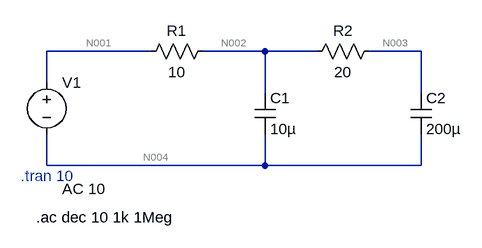
[diagram p0: schematic RC circuit control.asc]
RC circuit control.asc, the LTspice schematic file:
Version 4.1
SHEET 1 880 680
WIRE 224 80 64 80
WIRE 400 80 304 80
WIRE 480 80 400 80
WIRE 640 80 560 80
WIRE 64 128 64 80
WIRE 400 144 400 80
WIRE 640 144 640 80
WIRE 64 256 64 208
WIRE 400 256 400 208
WIRE 400 256 64 256
WIRE 640 256 640 208
WIRE 640 256 400 256
SYMBOL voltage 64 112 R0
WINDOW 3 24 152 Left 2
WINDOW 123 24 180 Left 2
WINDOW 39 0 0 Left 0
SYMATTR Value ""
SYMATTR Value2 AC 10
SYMATTR InstName V1
SYMBOL res 320 64 R90
WINDOW 0 0 56 VBottom 2
WINDOW 3 32 56 VTop 2
SYMATTR InstName R1
SYMATTR Value 10
SYMBOL res 576 64 R90
WINDOW 0 0 56 VBottom 2
WINDOW 3 32 56 VTop 2
SYMATTR InstName R2
SYMATTR Value 20
SYMBOL cap 384 144 R0
SYMATTR InstName C1
SYMATTR Value 10µ
SYMBOL cap 624 144 R0
SYMATTR InstName C2
SYMATTR Value 200µ
TEXT 24 272 Left 2 ;.tran 10
TEXT 48 336 Left 2 !.ac dec 10 1k 1Meg

The netlist it stands for:
* RC circuit control.asc
V1 N001 N004 AC 10
R1 N002 N001 10
R2 N003 N002 20
C1 N002 N004 10µ
C2 N003 N004 200µ
* .tran 10
.ac dec 10 1k 1Meg
.backanno
.end

* Results of the author's LTspice run, read from the files saved beside the schematic
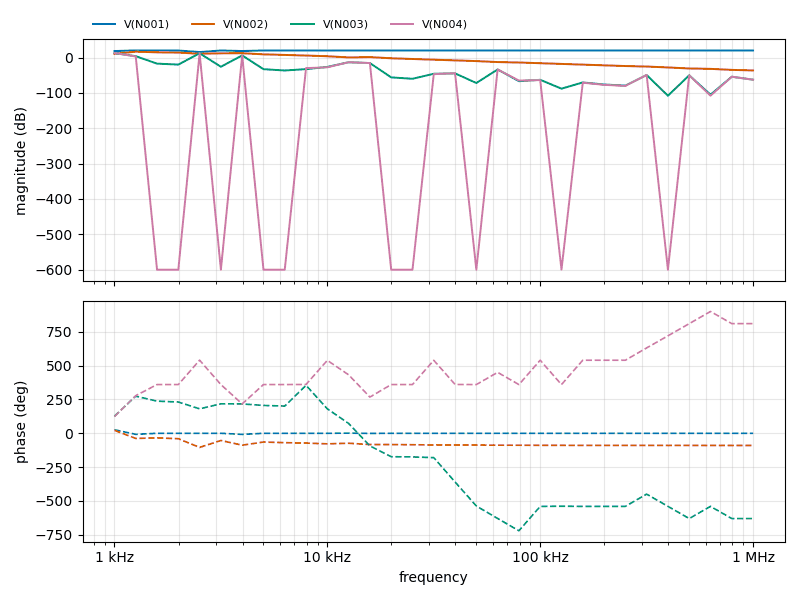
[diagram p1: AC Analysis of RC circuit control.asc, plotted from the saved traces]
* AC Analysis, 1 run:
*   V(N001): 18.48 dB at 1 kHz, 20.00 dB at 1 MHz, peak 20.25 dB at 1.259 kHz, 3 dB below the peak at 2.302 kHz
*   V(N002): 10.63 dB at 1 kHz, -36.38 dB at 1 MHz, peak 16.66 dB at 1.259 kHz, 3 dB below the peak at 1.122 kHz and 2.063 kHz
*   V(N003): 12.67 dB at 1 kHz, -62.57 dB at 1 MHz, peak 12.67 dB at 1 kHz, 3 dB below the peak at 1.082 kHz
*   V(N004): 12.94 dB at 1 kHz, -62.57 dB at 1 MHz, peak 12.94 dB at 1 kHz, 3 dB below the peak at 1.072 kHz